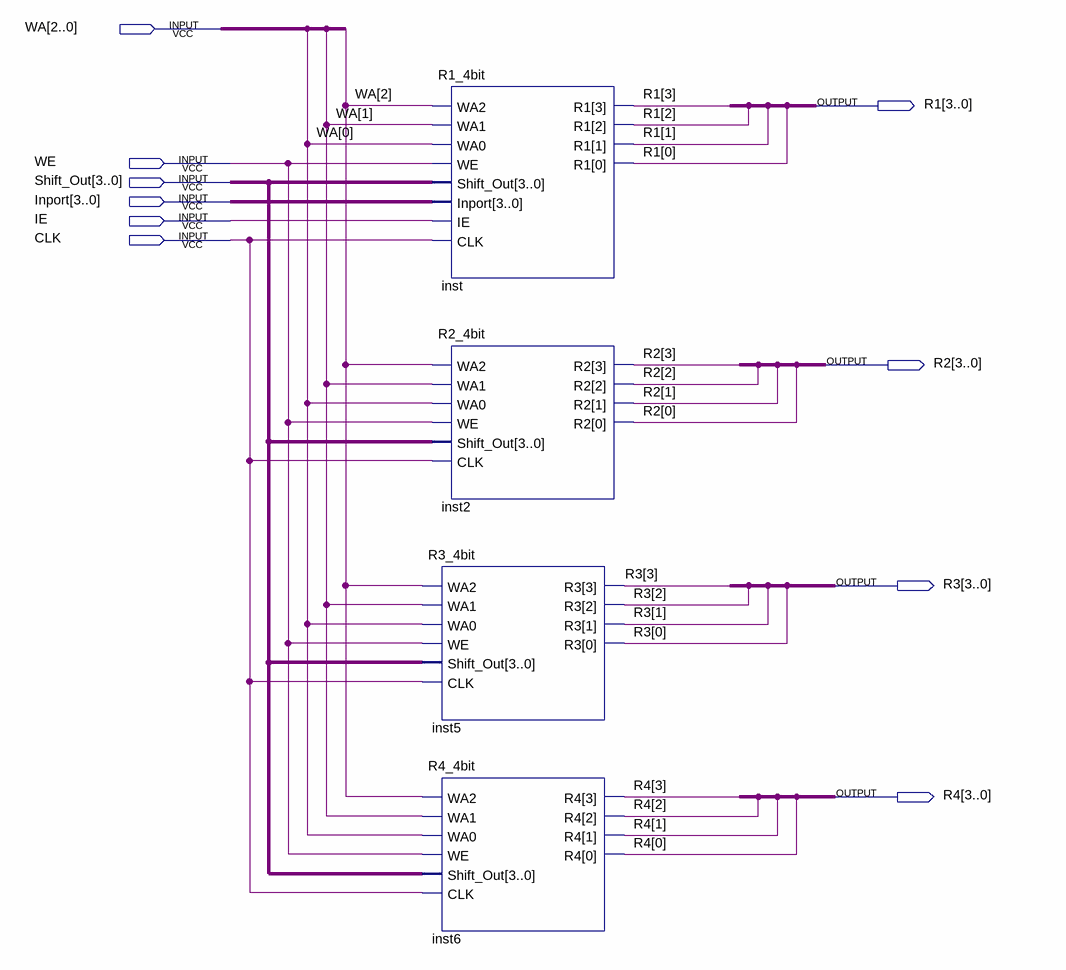
[diagram p0: schematic sheet]
// Quartus schematic register_4bit.bdf as structural Verilog: 4 symbols, 10 pins
module register_4bit (
  input  [2:0] WA,
  input  WE,
  input  [3:0] Shift_Out,
  input  [3:0] Inport,
  input  IE,
  input  CLK,
  output [3:0] R1,
  output [3:0] R2,
  output [3:0] R3,
  output [3:0] R4
);

  R1_4bit inst (
    .WA2(WA[2]), .WA1(WA[1]), .WA0(WA[0]), .WE(WE), .Shift_Out(Shift_Out), .Inport(Inport), .IE(IE),
    .CLK(CLK), .R1(R1));
  R2_4bit inst2 (.WA2(WA[2]), .WA1(WA[1]), .WA0(WA[0]), .WE(WE), .Shift_Out(Shift_Out), .CLK(CLK), .R2(R2));
  R3_4bit inst5 (.WA2(WA[2]), .WA1(WA[1]), .WA0(WA[0]), .WE(WE), .Shift_Out(Shift_Out), .CLK(CLK), .R3(R3));
  R4_4bit inst6 (.WA2(WA[2]), .WA1(WA[1]), .WA0(WA[0]), .WE(WE), .Shift_Out(Shift_Out), .CLK(CLK), .R4(R4));
endmodule
